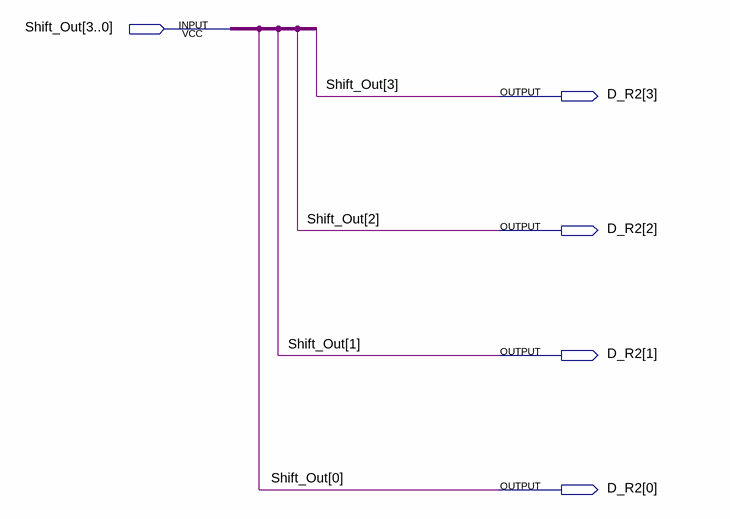
[diagram p0: schematic sheet]
// Quartus schematic D_R.bdf as structural Verilog: 0 symbols, 5 pins
module D_R (
  input  [3:0] Shift_Out,
  output [3:0] D_R2
);


  assign D_R2 = Shift_Out;
endmodule
